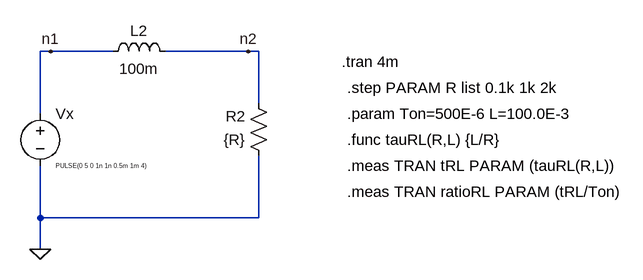
[diagram p0: schematic exp5 B.asc]
exp5 B.asc, the LTspice schematic file:
Version 4
SHEET 1 908 680
WIRE 0 0 -16 0
WIRE 96 0 0 0
WIRE 304 0 176 0
WIRE 320 0 304 0
WIRE 320 80 320 0
WIRE -16 96 -16 0
WIRE -16 256 -16 176
WIRE 320 256 320 160
WIRE 320 256 -16 256
WIRE -16 304 -16 256
FLAG -16 304 0
FLAG 0 0 n1
FLAG 304 0 n2
SYMBOL voltage -16 80 R0
WINDOW 3 24 96 Left 0
WINDOW 123 0 0 Left 0
WINDOW 39 0 0 Left 0
SYMATTR InstName Vx
SYMATTR Value PULSE(0 5 0 1n 1n 0.5m 1m 4)
SYMBOL res 336 176 R180
WINDOW 0 36 76 Left 2
WINDOW 3 36 40 Left 2
SYMATTR InstName R2
SYMATTR Value {R}
SYMBOL ind 80 16 R270
WINDOW 0 32 56 VTop 2
WINDOW 3 5 56 VBottom 2
SYMATTR InstName L2
SYMATTR Value 100m
TEXT 448 16 Left 2 !.tran 4m
TEXT 456 56 Left 2 !.step PARAM R list 0.1k 1k 2k
TEXT 456 96 Left 2 !.param Ton=500E-6 L=100.0E-3
TEXT 456 136 Left 2 !.func tauRL(R,L) {L/R}
TEXT 456 176 Left 2 !.meas TRAN tRL PARAM (tauRL(R,L))
TEXT 456 216 Left 2 !.meas TRAN ratioRL PARAM (tRL/Ton)

The netlist it stands for:
* exp5 B.asc
Vx n1 0 PULSE(0 5 0 1n 1n 0.5m 1m 4)
R2 0 n2 {R}
L2 n1 n2 100m
.tran 4m
.step PARAM R list 0.1k 1k 2k
.param Ton=500E-6 L=100.0E-3
.func tauRL(R,L) {L/R}
.meas TRAN tRL PARAM (tauRL(R,L))
.meas TRAN ratioRL PARAM (tRL/Ton)
.backanno
.end